# Altium schematic sheet Connector-Sheet.SchDoc
size A4; DocumentNumber: 3; SheetNumber: 3; SheetTotal: 3
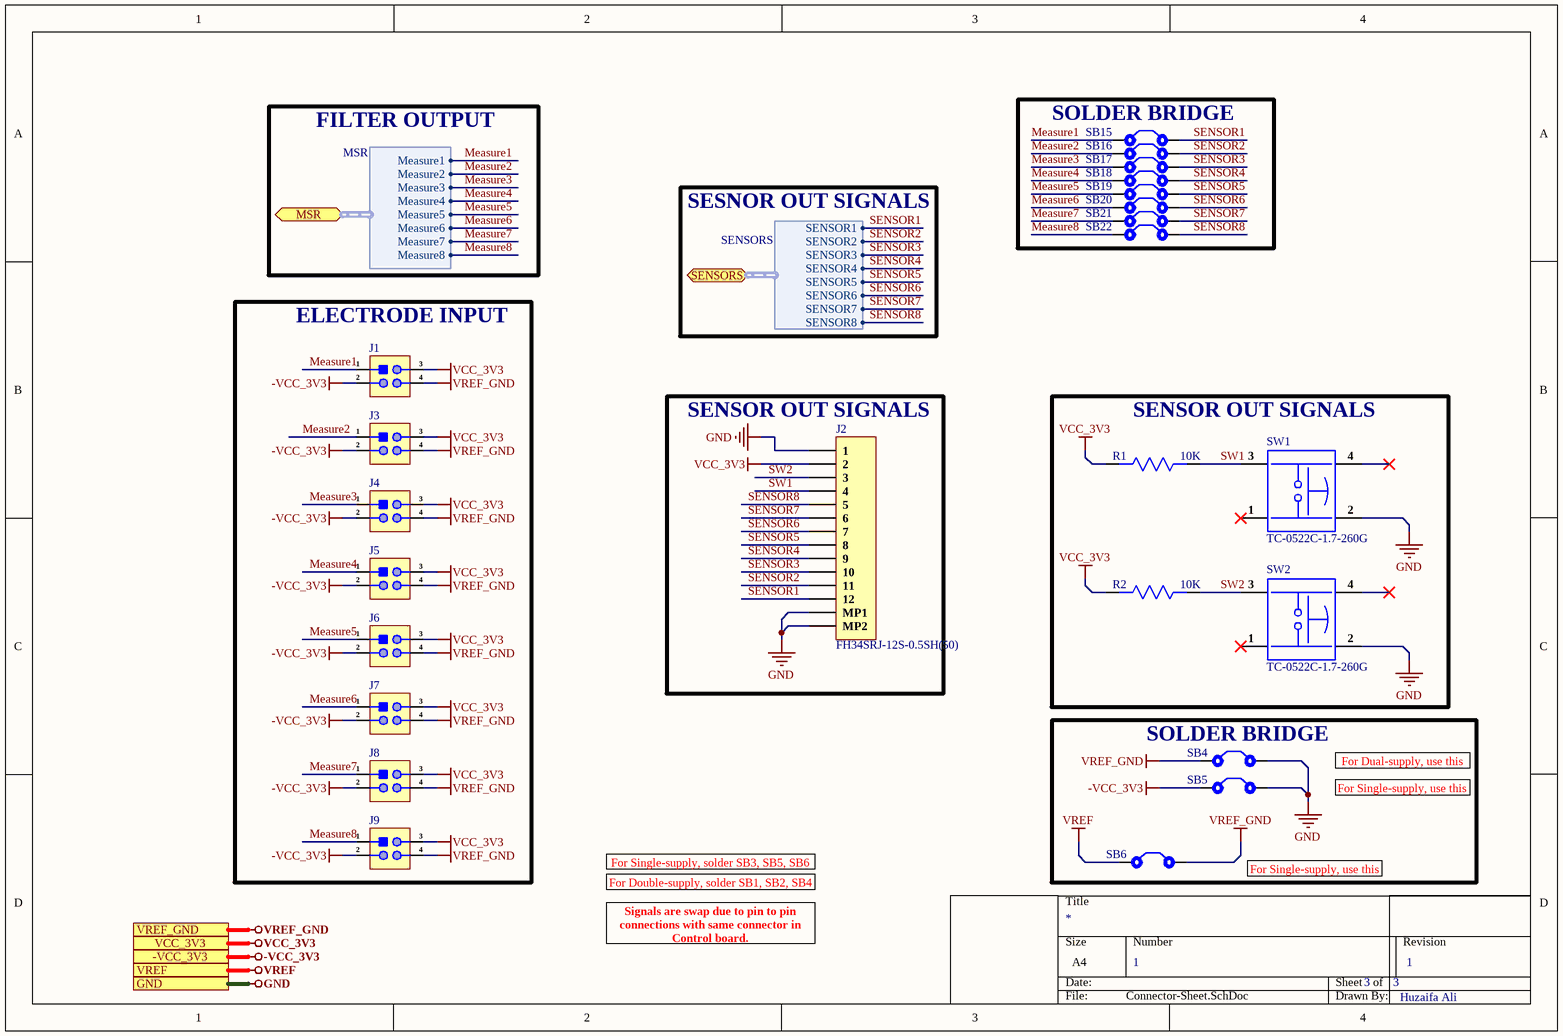
[diagram p0: Connector-Sheet.SchDoc]

## Parts
J1  2x2 Pad  [2x2 Pad]  (value not drawn)  (no BOM)
J2  FH34SRJ-12S-0.5SH(50)  [FH34SRJ-12S-0.5SH(50)_]
J3  2x2 Pad  [2x2 Pad]  (value not drawn)  (no BOM)
J4  2x2 Pad  [2x2 Pad]  (value not drawn)  (no BOM)
J5  2x2 Pad  [2x2 Pad]  (value not drawn)  (no BOM)
J6  2x2 Pad  [2x2 Pad]  (value not drawn)  (no BOM)
J7  2x2 Pad  [2x2 Pad]  (value not drawn)  (no BOM)
J8  2x2 Pad  [2x2 Pad]  (value not drawn)  (no BOM)
J9  2x2 Pad  [2x2 Pad]  (value not drawn)  (no BOM)
R1  10K  [Res-0402]
R2  10K  [Res-0402]
SB4  Solder Bridge  [Solder Bridge]  (value not drawn)
SB5  Solder Bridge  [Solder Bridge]  (value not drawn)
SB6  Solder Bridge  [Solder Bridge]  (value not drawn)
SB15  Solder Bridge 0603  [Solder Bridge]  (value not drawn)  (no BOM)
SB16  Solder Bridge 0603  [Solder Bridge]  (value not drawn)  (no BOM)
SB17  Solder Bridge 0603  [Solder Bridge]  (value not drawn)  (no BOM)
SB18  Solder Bridge 0603  [Solder Bridge]  (value not drawn)  (no BOM)
SB19  Solder Bridge 0603  [Solder Bridge]  (value not drawn)  (no BOM)
SB20  Solder Bridge 0603  [Solder Bridge]  (value not drawn)  (no BOM)
SB21  Solder Bridge 0603  [Solder Bridge]  (value not drawn)  (no BOM)
SB22  Solder Bridge 0603  [Solder Bridge]  (value not drawn)  (no BOM)
SW1  TC-0522C-1.7-260G  [TC-0522C-1.7-260G_]
SW2  TC-0522C-1.7-260G  [TC-0522C-1.7-260G_]

## Blocks framed on the sheet
SOLDER BRIDGE: SB15-SB22
ELECTRODE INPUT: J1 J3-J9
SENSOR OUT SIGNALS: J2
SENSOR OUT SIGNALS: R1 R2 SW1 SW2
SOLDER BRIDGE: SB4-SB6

## Ports
-VCC_3V3, GND, MSR (bidir, harness MSR), SENSORS (bidir, harness SENSORS), VCC_3V3, VREF, VREF_GND

## Harnesses
SENSORS: SENSOR1, SENSOR2, SENSOR3, SENSOR4, SENSOR5, SENSOR6, SENSOR7, SENSOR8
MSR: Measure1, Measure2, Measure3, Measure4, Measure5, Measure6, Measure7, Measure8

## Nets
-VCC_3V3: J1.2 J3.2 J4.2 J5.2 J6.2 J7.2 J8.2 J9.2 SB5.1 ; port -VCC_3V3
GND: J2.1 J2.MP1 J2.MP2 SB4.2 SB5.2 SW1.2 SW2.2 ; port GND
VCC_3V3: J1.3 J2.2 J3.3 J4.3 J5.3 J6.3 J7.3 J8.3 J9.3 R1.2 R2.2 ; port VCC_3V3
VREF: SB6.1 ; port VREF
VREF_GND: J1.4 J3.4 J4.4 J5.4 J6.4 J7.4 J8.4 J9.4 SB4.1 SB6.2 ; port VREF_GND
Measure1: J1.1 SB15.1 ; port MSR.Measure1
Measure2: J3.1 SB16.1 ; port MSR.Measure2
Measure3: J4.1 SB17.1 ; port MSR.Measure3
Measure4: J5.1 SB18.1 ; port MSR.Measure4
Measure5: J6.1 SB19.1 ; port MSR.Measure5
Measure6: J7.1 SB20.1 ; port MSR.Measure6
Measure7: J8.1 SB21.1 ; port MSR.Measure7
Measure8: J9.1 SB22.1 ; port MSR.Measure8
SENSOR1: J2.12 SB15.2 ; port SENSORS.SENSOR1
SENSOR2: J2.11 SB16.2 ; port SENSORS.SENSOR2
SENSOR3: J2.10 SB17.2 ; port SENSORS.SENSOR3
SENSOR4: J2.9 SB18.2 ; port SENSORS.SENSOR4
SENSOR5: J2.8 SB19.2 ; port SENSORS.SENSOR5
SENSOR6: J2.7 SB20.2 ; port SENSORS.SENSOR6
SENSOR7: J2.6 SB21.2 ; port SENSORS.SENSOR7
SENSOR8: J2.5 SB22.2 ; port SENSORS.SENSOR8
SW1: J2.4 R1.1 SW1.3
SW2: J2.3 R2.1 SW2.3

Not connected (* = marked no-connect by the designer): SW1 1* 4*; SW2 1* 4*

## Notes on the sheet
- FILTER OUTPUT
- SESNOR OUT SIGNALS
- For Single-supply, use this
- For Dual-supply, use this
- For Single-supply, solder SB3, SB5, SB6
- For Double-supply, solder SB1, SB2, SB4
- Signals are swap due to pin to pin connections with same connector in Control board.
- 1
- Huzaifa Ali

## Library data of the parts
J1 J3-J9 = 2x2 Pad: Wire Connecting Pad
J2 = FH34SRJ-12S-0.5SH(50): CONN FPC/FFC 12POS .5MM; Manufacturer: Hirose; Item Type: FFC Connector; Supplier 1: Digi-Key; Manufacturer Part Number: FH34SRJ-12S-0.5SH(50); RoHS: Yes; Category: FFC / FPC; Pricing 1: 5000=0.47775 (USD); ComponentLink1URL: https://www.hirose.com/product/en/download_file/key_name/FH34SRJ/category/Catalog/doc_file_id/31646/?file_category_id=4&item_id=27&is_series=1&src-supplier=Digi-Key; ComponentLink1Description: https://www.hirose.com/product/en/download_file/key_name/FH34SRJ/category/Catalog/doc_file_id/31646/?file_category_id=4&item_id=27&is_series=1&src-supplier=Digi-Key; Supplier Part Number 1: FH34SRJ-12S-0.5SH(50)-ND; LCSC Part Number: C424659
R1 R2 = RC0402FR-0710KL: RES 10K OHM 1% 1/16W 0402; Manufacturer: Yageo; Resistance: 10kR; Temperature Coefficient: 100ppm/°C; Voltage Rating (DC): 50V; Power Rating: 62.5mW; Max Power Dissipation: 63mW; Supplier 1: Mouser; Manufacturer Part Number: RC0402FR-0710KL; Stock 1: 18648329; Pricing 1: 1=0.10000, 10=0.01400, 50=0.01400, 100=0.00500, 1000=0.00300, 10000=0.00200 (USD); Case/Package: 0402; Number of Pins: 2; Case Code (Imperial): 0402; Case Code (Metric): 1005; Min Operating Temperature: -55°C; Max Operating Temperature: 155°C; Tolerance: 1%; Packaging: Tape and Reel; Voltage Rating: 50V; Termination: SMD/SMT; Military Standard: Not; Working Voltage: 50V; Number of Terminations: 2; Length: 1mm; Height: 0.32mm; Width: 0.5mm; Depth: 0.5mm; Lead Pitch: 0.2mm; REACH SVHC: No SVHC; Lead Free: Lead Free; ComponentLink1URL: https://datasheet.ciiva.com/7660/38568-7660787.pdf?src-supplier=Element14; ComponentLink1Description: https://datasheet.ciiva.com/7660/38568-7660787.pdf?src-supplier=Element14; ComponentLink2URL: https://datasheet.ciiva.com/7849/1686128-7849814.pdf?src-supplier=Element14; ComponentLink2Description: https://datasheet.ciiva.com/7849/1686128-7849814.pdf?src-supplier=Element14; ComponentLink3URL: https://datasheet.ciiva.com/7983/1018594-7983486.pdf?src-supplier=Element14; ComponentLink3Description: https://datasheet.ciiva.com/7983/1018594-7983486.pdf?src-supplier=Element14; ComponentLink4URL: https://datasheet.ciiva.com/22747/1018594-22747512.pdf?src-supplier=Element14; ComponentLink4Description: https://datasheet.ciiva.com/22747/1018594-22747512.pdf?src-supplier=Element14; Supplier Part Number 1: 603-RC0402FR-0710KL; RoHS: Yes; Category: Chip SMD Resistors; Resistor Type: Thick Film; Features: Moisture Resistant; Series: RC; Resistance Tolerance: 1%; Construction: Rectangular; RoHS Compliant: Yes; ComponentLink5URL: https://datasheet.ciiva.com/12667/pyu-rc0402-51-rohs-l-6-r-12667067.pdf?src-supplier=Mouser; ComponentLink5Description: https://datasheet.ciiva.com/12667/pyu-rc0402-51-rohs-l-6-r-12667067.pdf?src-supplier=Mouser; ComponentLink6URL: https://datasheet.ciiva.com/7849/1784430-7849813.pdf?src-supplier=Element14; ComponentLink6Description: https://datasheet.ciiva.com/7849/1784430-7849813.pdf?src-supplier=Element14; ComponentLink7URL: https://datasheet.ciiva.com/7849/1784430-7849815.pdf?src-supplier=Element14; ComponentLink7Description: https://datasheet.ciiva.com/7849/1784430-7849815.pdf?src-supplier=Element14; LCSC Part Number: C60490
SB4-SB6 = Solder Bridge: Solder Bridge ON
SB15-SB22 = Solder Bridge 0603: Solder Bridge ON; Manufacturer Part Number: Solder Bridge; Item Type: Solder Bridge
SW1 SW2 = TC-0522C-1.7-260G: No Gull Wing 50mA 100MΩ 80000 260gf@±50gf 12V -25℃~+85℃ 1.7mm Golden Round Button Brick nogging SPST SMD Tactile Switches ROHS; Manufacturer: HCTL; Item Type: Switch; Manufacturer Part Number: TC-0522C-1.7-260G; Value: -; Footprint: Custom; ComponentLink1Description: LCSC; ComponentLink1URL: https://www.lcsc.com/product-detail/Tactile-Switches_HCTL-TC-0522C-1-7-260G_C2845290.html; LCSC Part Number: C2845290